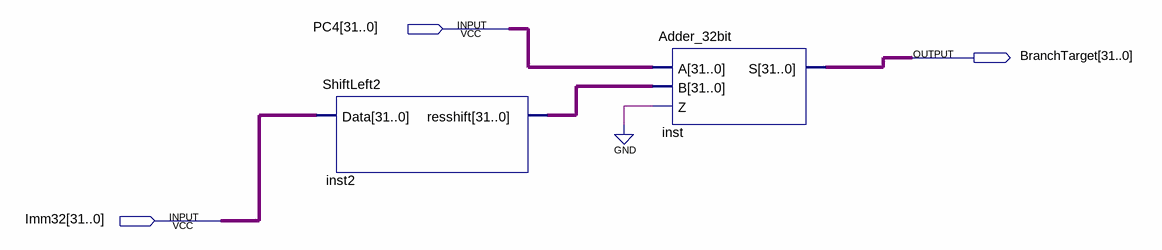
[diagram p0: schematic sheet]
// Quartus schematic BranchAdder32bit.bdf as structural Verilog: 2 symbols, 3 pins
module BranchAdder32bit (
  input  [31:0] PC4,
  input  [31:0] Imm32,
  output [31:0] BranchTarget
);

  wire [31:0] inst2_resshift;

  ShiftLeft2 inst2 (.Data(Imm32), .resshift(inst2_resshift));
  Adder_32bit inst (.A(PC4), .B(inst2_resshift), .Z(1'b0), .S(BranchTarget));
endmodule
